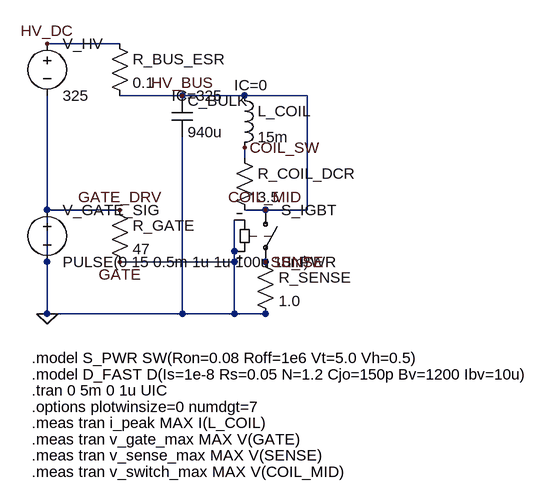
[diagram p0: schematic test_emc100_clean.asc]
test_emc100_clean.asc, the LTspice schematic file:
Version 4
SHEET 1 1280 800
WIRE 64 16 176 16
WIRE 176 96 272 96
WIRE 272 96 368 96
WIRE 368 96 464 96
WIRE 64 96 64 432
WIRE 64 432 272 432
WIRE 272 160 272 432
WIRE 272 432 400 432
WIRE 400 432 64 432
WIRE 368 176 368 192
WIRE 368 272 400 272
WIRE 400 272 464 272
WIRE 464 272 464 160
WIRE 464 96 464 160
WIRE 400 352 400 336
WIRE 64 272 176 272
WIRE 64 352 64 432
WIRE 176 352 352 352
WIRE 352 352 352 336
WIRE 352 288 352 432
FLAG 64 432 0
FLAG 64 16 HV_DC
FLAG 272 96 HV_BUS
FLAG 368 176 COIL_SW
FLAG 400 272 COIL_MID
FLAG 176 272 GATE_DRV
FLAG 176 352 GATE
FLAG 400 352 SENSE
SYMBOL voltage 64 0 R0
WINDOW 123 0 0 Left 2
WINDOW 39 0 0 Left 2
SYMATTR InstName V_HV
SYMATTR Value 325
SYMBOL res 160 0 R0
WINDOW 123 0 0 Left 2
WINDOW 39 0 0 Left 2
SYMATTR InstName R_BUS_ESR
SYMATTR Value 0.1
SYMBOL cap 256 96 R0
WINDOW 123 0 0 Left 2
WINDOW 39 0 0 Left 2
SYMATTR InstName C_BULK
SYMATTR Value 940u
SYMATTR SpiceLine IC=325
SYMBOL ind 352 80 R0
WINDOW 123 0 0 Left 2
WINDOW 39 0 0 Left 2
SYMATTR InstName L_COIL
SYMATTR Value 15m
SYMATTR SpiceLine IC=0
SYMBOL res 352 176 R0
WINDOW 123 0 0 Left 2
WINDOW 39 0 0 Left 2
SYMATTR InstName R_COIL_DCR
SYMATTR Value 3.5
SYMBOL sw 400 256 R0
WINDOW 123 0 0 Left 2
WINDOW 39 0 0 Left 2
SYMATTR InstName S_IGBT
SYMATTR Value S_PWR
SYMBOL res 384 336 R0
WINDOW 123 0 0 Left 2
WINDOW 39 0 0 Left 2
SYMATTR InstName R_SENSE
SYMATTR Value 1.0
SYMBOL voltage 64 256 R0
WINDOW 123 0 0 Left 2
WINDOW 39 0 0 Left 2
SYMATTR InstName V_GATE_SIG
SYMATTR Value PULSE(0 15 0.5m 1u 1u 100u 10m)
SYMBOL res 160 256 R0
WINDOW 123 0 0 Left 2
WINDOW 39 0 0 Left 2
SYMATTR InstName R_GATE
SYMATTR Value 47
TEXT 40 500 Left 2 !.model S_PWR SW(Ron=0.08 Roff=1e6 Vt=5.0 Vh=0.5)
TEXT 40 525 Left 2 !.model D_FAST D(Is=1e-8 Rs=0.05 N=1.2 Cjo=150p Bv=1200 Ibv=10u)
TEXT 40 550 Left 2 !.tran 0 5m 0 1u UIC
TEXT 40 575 Left 2 !.options plotwinsize=0 numdgt=7
TEXT 40 600 Left 2 !.meas tran i_peak MAX I(L_COIL)
TEXT 40 625 Left 2 !.meas tran v_gate_max MAX V(GATE)
TEXT 40 650 Left 2 !.meas tran v_sense_max MAX V(SENSE)
TEXT 40 675 Left 2 !.meas tran v_switch_max MAX V(COIL_MID)

The netlist it stands for:
* test_emc100_clean.asc
V_HV HV_DC 0 325
R_BUS_ESR HV_DC COIL_MID 0.1
C_BULK COIL_MID 0 940u IC=325
L_COIL COIL_MID COIL_SW 15m IC=0
R_COIL_DCR COIL_SW COIL_MID 3.5
S_IGBT COIL_MID SENSE 0 0 S_PWR
R_SENSE SENSE 0 1.0
V_GATE_SIG 0 0 PULSE(0 15 0.5m 1u 1u 100u 10m)
R_GATE 0 0 47
.model S_PWR SW(Ron=0.08 Roff=1e6 Vt=5.0 Vh=0.5)
.model D_FAST D(Is=1e-8 Rs=0.05 N=1.2 Cjo=150p Bv=1200 Ibv=10u)
.tran 0 5m 0 1u UIC
.options plotwinsize=0 numdgt=7
.meas tran i_peak MAX I(L_COIL)
.meas tran v_gate_max MAX V(GATE)
.meas tran v_sense_max MAX V(SENSE)
.meas tran v_switch_max MAX V(COIL_MID)
.backanno
.end